# EasyEDA Pro project base_pcb.epro

# Board PCB1
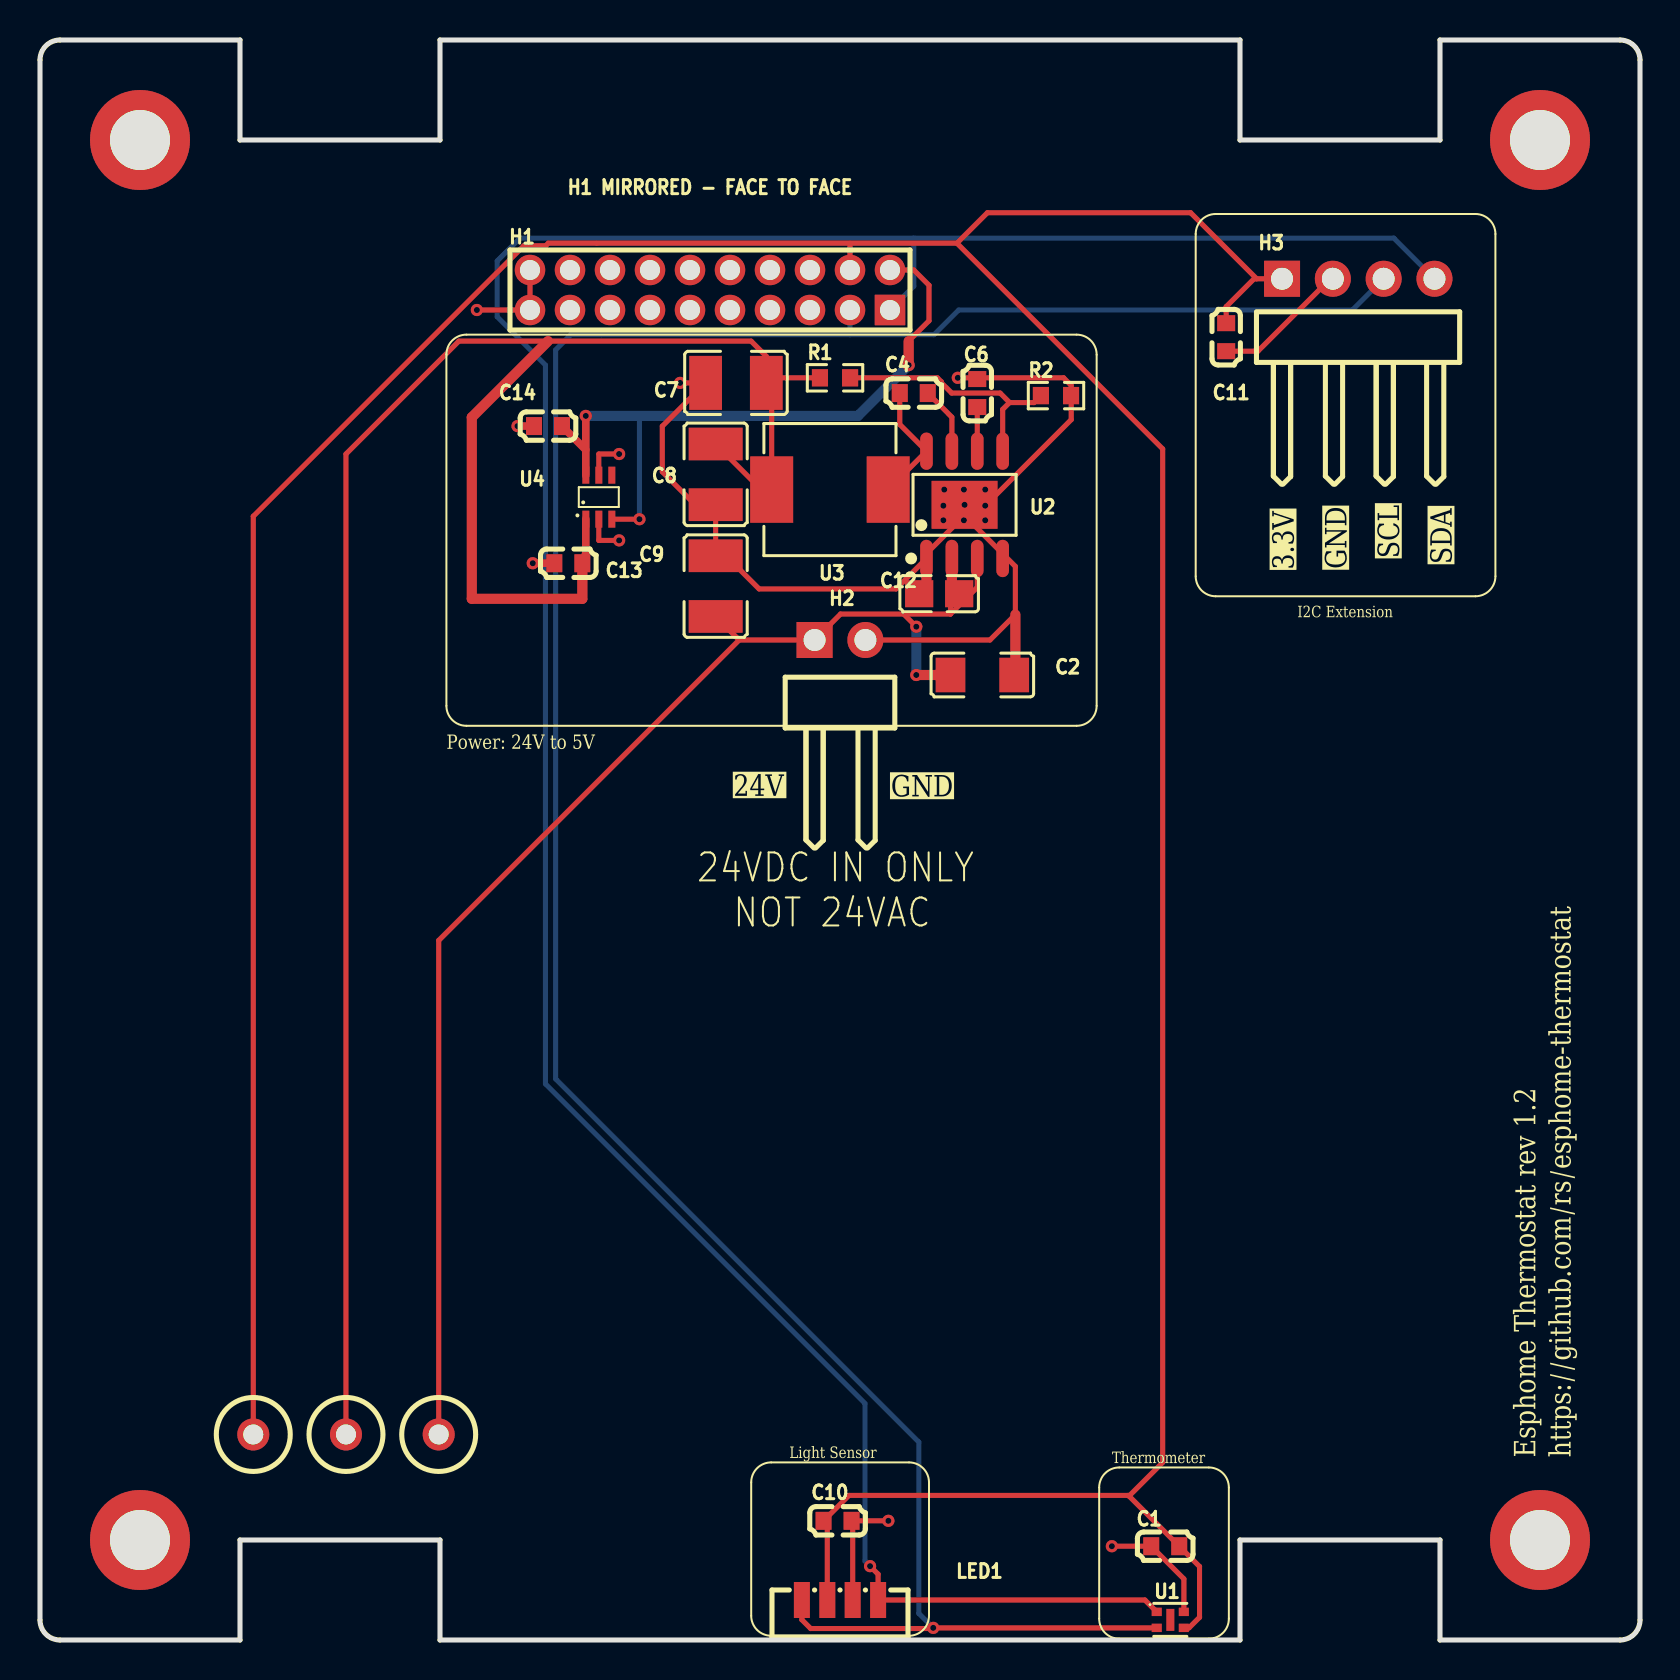
[diagram p0: board, top side]
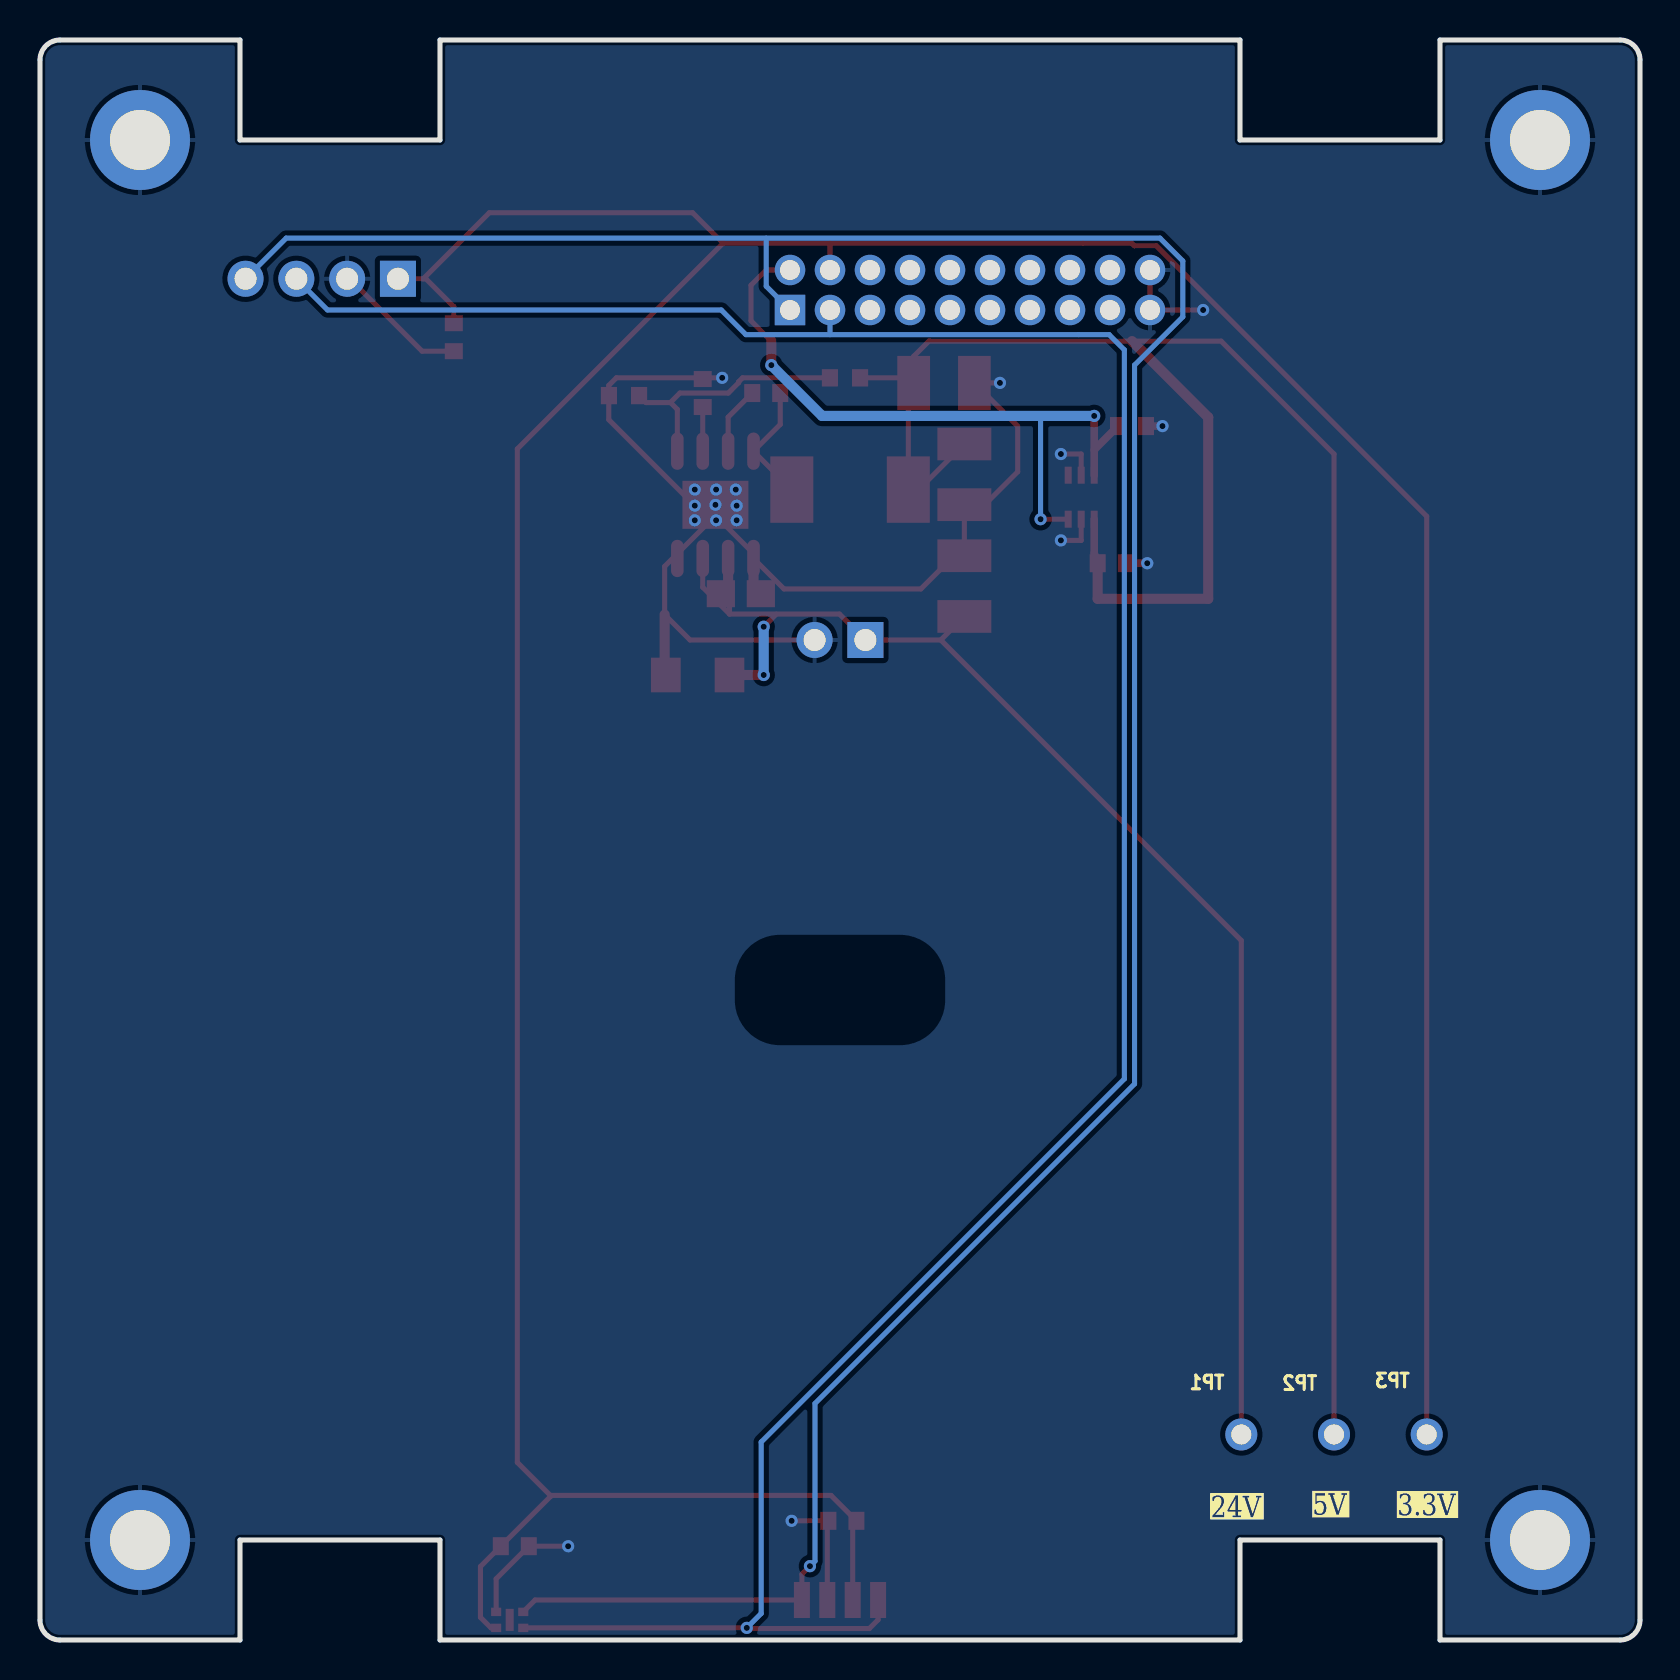
[diagram p1: board, bottom side, seen from below]

Outline 80 x 80 mm; copper layers: Top Layer, Bottom Layer. Coordinates in mm from the lower left corner of the outline.
Outline path: 0,79 0,1 arc(0.29,0.29) 1,0 10,0 10,5 20,5 20,0 60,0 60,5 70,5 70,0 79,0 arc(79.71,0.29) 80,1 80,79 arc(79.71,79.71) 79,80 70,80 70,75 60,75 60,80 20,80 20,75 10,75 10,80 1,80 arc(0.29,79.71) 0,79
Stack: Top Layer 0.035mm / Dielectric1 1.51mm FR4 er 4.5 / Bottom Layer 0.035mm

## Design rules (mm)
template: JLCPCB Capability(Two Layers Board)
spacing copperThickness1oz (default): track to track 0.102, other pairs 0.152 to 0.3
spacing copperThickness2oz: track to track 0.203, other pairs 0.152 to 0.3
track width copperThickness1oz (default): min 0.127, default 0.254, max 2.54
track width copperThickness2oz: min 0.203, default 0.254, max 2.54
differential pair differentialPair (default): width min 0.127, default 0.254, max 2.54; gap min 0.152, default 0.152
via viaSize (default): diameter min 0.5, default 0.61, max 10; hole min 0.3, default 0.305, max 6.3

## Placement (name value [footprint] x y rotation side)
C1  100nF  [C0603]  56.26 4.69 0 top
C2  4.7uF  [C1206]  47.12 48.25 0 top
C4  100nF  [C0603]  43.69 62.35 180 top
C6  1uF  [C0603]  46.86 62.35 270 top
C7  22uF  [C1210]  34.8 62.86 180 top
C8  22uF  [C1210]  33.78 58.28 270 top
C9  4.7uF  [C1210]  33.78 52.69 90 top
C10  100nF  [C0603]  39.88 5.96 180 top
C11  100nF  [C0603]  59.31 65.14 90 top
C12  220nF  [C0805]  44.96 52.31 180 top
C13  1uF  [C0603]  26.42 53.84 180 top
C14  1uF  [C0603]  25.4 60.7 180 top
H1  FG-PZ2.0-2-10P  [THERMOSTAT-H1-2X10-P2.00-MIRRORED-X]  33.5 67.5 0 top
H2  PZ254R-11-02P  [HDR-TH_2P-P2.54-H-M-W10.4]  40 50 0 top
H3  PZ254R-11-04P  [HDR-TH_4P-P2.54-H-M-W10.4]  65.91 68.06 0 top
LED1  VEML7700-TR  [LED-SMD_4P-L6.8-W2.4_VEML7700-TR]  40 2 180 top
NOREF  -  [Pad_e832]  5 75 0 top
NOREF#2  -  [Pad_e834]  5 5 0 top
NOREF#3  -  [Pad_e836]  75 75 0 top
NOREF#4  -  [Pad_e835]  75 5 0 top
R1  100kΩ  [R0603]  39.75 63.11 0 top
R2  24.9kΩ  [R0603]  50.8 62.22 0 top
TP1  -  [TESTPOINT-TH_TP_4]  19.94 10.28 0 top
TP2  -  [TESTPOINT-TH_TP_4]  15.3 10.28 0 top
TP3  -  [TESTPOINT-TH_TP_4]  10.66 10.28 0 top
U1  SHT45-AD1B-R2  [DFN-4_L1.5-W1.5-P0.8-TL-EP]  56.51 1.01 0 top
U2  LMR36510FADDAR  [ESOP-8_L4.9-W3.9-P1.27-LS6.0-BL-EP-1]  46.23 56.76 0 top
U3  22uH  [IND-SMD_L7.1-W6.6]  39.5 57.52 180 top
U4  LM66100DCKR  [SC-70-6_L2.0-W1.3-P0.65-LS2.1-BL]  27.94 57.14 0 top

## Footprints (pads in the part's own frame, mm; a bottom-side part is the same pattern mirrored in y, then rotated)
C0603
  rect 0.8x0.9 smd: 1(-0.7,0) 2(0.7,0)
C0805
  rect 1.41x1.35 smd: 1(-1,0) 2(1,0)
C1206
  rect 1.485x1.728 smd: 1(-1.593,0) 2(1.593,0)
C1210
  rect 1.635x2.7 smd: 1(-1.518,0) 2(1.518,0)
DFN-4_L1.5-W1.5-P0.8-TL-EP
  rect 0.505x0.42 smd: 1(-0.677,0.4) 2(-0.677,-0.4) 3(0.677,-0.4) 4(0.677,0.4)
  rect 0.4x1.1 smd: 5(0,0)
ESOP-8_L4.9-W3.9-P1.27-LS6.0-BL-EP-1
  oval 0.63x1.865 smd: 1(-1.905,-2.683) 2(-0.635,-2.683) 3(0.635,-2.683) 4(1.905,-2.683) 5(1.905,2.683) 6(0.635,2.683) 7(-0.635,2.683) 8(-1.905,2.683)
  rect 3.3x2.4 smd: 9(0,0)
HDR-TH_2P-P2.54-H-M-W10.4
  rect 1.8x1.8 hole 1.1: 1(-1.27,0)
  round 1.8 hole 1.1: 2(1.27,0)
HDR-TH_4P-P2.54-H-M-W10.4
  rect 1.8x1.8 hole 1.1: 1(-3.81,0)
  round 1.8 hole 1.1: 2(-1.27,0) 3(1.27,0) 4(3.81,0)
IND-SMD_L7.1-W6.6
  rect 2.15x3.32 smd: 1(-2.913,0) 2(2.913,0)
LED-SMD_4P-L6.8-W2.4_VEML7700-TR
  rect 0.8x1.8 smd: 1(1.905,0) 2(0.635,0) 3(-0.635,0) 4(-1.905,0)
Pad_e832
  round 5 hole 3: 1(0,0)
Pad_e834
  round 5 hole 3: 1(0,0)
Pad_e835
  round 5 hole 3: 1(0,0)
Pad_e836
  round 5 hole 3: 1(0,0)
R0603
  rect 0.806x0.864 smd: 1(-0.753,0) 2(0.753,0)
SC-70-6_L2.0-W1.3-P0.65-LS2.1-BL
  rect 0.35x0.85 smd: 1(-0.65,-1.1) 2(0,-1.1) 3(0.65,-1.1) 4(0.65,1.1) 5(0,1.1) 6(-0.65,1.1)
TESTPOINT-TH_TP_4
  round 1.6 hole 1: 1(0,0)
THERMOSTAT-H1-2X10-P2.00-MIRRORED-X
  rect 1.524x1.524 hole 1: 1(9,-1)
  round 1.524 hole 1: 2(9,1) 3(7,-1) 4(7,1) 5(5,-1) 6(5,1) 7(3,-1) 8(3,1) 9(1,-1) 10(1,1) 11(-1,-1) 12(-1,1) 13(-3,-1) 14(-3,1) 15(-5,-1) 16(-5,1) 17(-7,-1) 18(-7,1) 19(-9,-1) 20(-9,1)

## Nets
3V3: C1.2 C10.2 C11.2 H1.4 H3.1 LED1.2 TP3.1 U1.3
+5V: C7.1 C8.1 C13.1 R1.1 TP2.1 U3.2 U4.1
+5V_DISPLAY: C14.1 H1.2 U4.3 U4.6
+24V: C2.1 C9.1 C12.1 H2.1 TP1.1 U2.2 U2.3
GND: C1.1 C2.2 C6.1 C7.2 C8.2 C9.2 C10.1 C11.1 C12.2 C13.2 C14.2 H1.19 H1.20 H2.2 H3.2 LED1.3 NOREF.1 NOREF#2.1 NOREF#3.1 NOREF#4.1 R2.2 U1.4 U2.1 U2.4 U2.9 U4.2 U4.5
FB: R1.2 R2.1 U2.5
SCL: H1.3 H3.3 LED1.1 U1.2
SDA: H1.1 H3.4 LED1.4 U1.1
$1N2931: C4.2 U2.8 U3.1
$1N3165: C4.1 U2.7
$1N3213: C6.2 U2.6

Pads without a net: H1 5 6 7 8 9 10 11 12 13 14 15 16 17 18; U1 5; U4 4

## Via types
v1: diameter 0.61, hole 0.305, Top Layer to Bottom Layer, 25 vias

## Routing (per net, layer and track width the routed paths; a pad name or vN(x,y) marks a point on that pad's centre or on a via; arc(x,y) is an arc through that point)
3V3: length 205.9
  Top Layer w0.254: TP3.1 10.66,56.19 24.19,69.71 25.29,69.71 25.41,69.84 45.85,69.84 ; 54.45,7.2 C1.2 57.98,3.67 57.98,1.13 57.45,0.61 U1.3 ; 54.45,7.2 56.13,8.88 56.13,59.55 45.85,69.84 ; 54.45,7.2 54.42,7.23 40.45,7.23 C10.2 39.37,5.77 39.37,1.3 ; H3.1 60.83,68.06 ; 60.83,68.06 60.71,68.06 59.31,66.67 59.31,65.84 ; 60.83,68.06 57.53,71.36 47.37,71.36 45.85,69.84 ; H1.4 40.5,69.84
+5V: length 109.1
  Top Layer w0.254: TP2.1 15.3,59.3 20.94,64.94 35.55,64.94 36.32,64.18 C7.1 ; 36.58,62.47 U3.2 36.06,57.52 C8.1 ; 36.57,63.11 R1.1
  Top Layer w0.381: U4.1 27.29,54.35 C13.1
  Top Layer w0.508: C13.1 27.12,52.06 21.59,52.06 21.59,61.13 25.4,64.94
+5V_DISPLAY: length 35.1
  Top Layer w0.254: H1.2 43.69,68.5 44.45,67.74 44.45,65.96 43.43,64.94 ; U4.3 v1(29.97,56.04)
  Top Layer w0.381: U4.6 v1(27.29,61.2) ; 27.29,59.51 C14.1
  Top Layer w0.508: v1(43.43,63.74) 43.43,64.94
  Bottom Layer w0.254: v1(29.97,56.04) 29.97,61.2
  Bottom Layer w0.508: v1(43.43,63.74) 40.89,61.2 v1(27.29,61.2)
+24V: length 71.7
  Top Layer w0.254: 34.96,50 19.94,34.98 TP1.1 ; 34.96,50 C9.1 ; 34.96,50 H2.1 40.03,51.3 45.52,51.3 ; 45.52,51.3 46.86,52.64 U2.3 ; 45.52,51.3 45.52,54.01 ; 43.18,51.3 v1(43.81,50.66)
  Top Layer w0.508: 45.59,54.08 45.59,52.68 C12.1 ; v1(43.81,48.25) C2.1
  Bottom Layer w0.508: v1(43.81,50.66) v1(43.81,48.25)
GND: length 89.3
  Top Layer w0.254: H2.2 47.5,50 48.77,51.27 48.77,53.68 46.58,55.87 45.87,55.87 44.32,54.32 ; v1(21.84,66.5) H1.19 H1.20 ; v1(45.89,63.11) 51.18,63.11 51.56,62.73 51.56,61.02 v1(47.26,56.72) ; U4.5 27.94,59.3 v1(28.96,59.3) ; H3.2 64.52,68.06 60.9,64.44 C11.1 ; U4.2 27.94,54.98 v1(28.96,54.98) ; v1(32,62.86) C7.2 31.12,60.69 31.12,58.41 32.76,56.77 C8.2 C9.2 34.3,54.21 35.96,52.55 42.8,52.55 U2.1 ; 40.63,5.9 40.63,1.3 ; v1(53.59,4.69) C1.1 57.19,3.06 U1.4 ; C10.1 v1(42.42,5.96)
  Top Layer w0.381: C14.2 v1(23.88,60.7) ; C13.2 v1(24.64,53.84)
  Top Layer w0.508: U2.1 44.32,52.68 C12.2 ; 48.77,51.27 48.77,48.25
  vias: v1(45.21,57.52) v1(45.17,56.72) v1(45.17,55.99) v1(46.19,57.52) v1(46.23,56.76) v1(46.19,55.99) v1(47.26,57.52) v1(47.26,55.99)
FB: length 12.8
  Top Layer w0.254: 48.47,61.87 48.47,61.88 48.01,62.35 45.58,62.35 45.07,62.86 45.07,62.91 44.87,63.11 R1.2 ; 48.47,61.87 48.13,61.53 U2.5 ; 48.47,61.87 49.7,61.87 R2.1
SCL: length 134.8
  Top Layer w0.254: LED1.1 38.09,1.01 38.53,0.57 44.63,0.57 v1(44.66,0.61) U1.2
  Bottom Layer w0.254: H3.3 65.62,66.5 45.94,66.5 44.7,65.27 26.54,65.27 25.78,64.51 25.78,28.06 43.94,9.9 43.94,1.33 v1(44.66,0.61) ; H1.3 40.5,65.27
SDA: length 141.3
  Top Layer w0.254: U1.1 55.24,2 LED1.4 41.91,3.29 v1(41.5,3.69)
  Bottom Layer w0.254: H3.4 67.69,70.09 24,70.09 22.86,68.95 22.86,66.16 25.27,63.74 25.27,27.8 41.25,11.83 41.25,3.95 v1(41.5,3.69) ; H1.1 43.69,67.69 43.69,70.09
$1N2931: length 6.2
  Top Layer w0.254: U3.1 44.32,59.43 U2.8 42.99,60.78 C4.2
$1N3165: length 3.4
  Top Layer w0.254: 45.59,59.44 45.59,61.14 C4.1
$1N3213: length 2.2
  Top Layer w0.254: 46.86,61.65 U2.6

## Copper pours and planes (outline as drawn; the poured copper is in the pictures)
GND on Bottom Layer: 0,80 80,80 80,0 0,0

## Text on the board
Bottom Silkscreen Layer: 3.3V | 5V | 24V
Top Silkscreen Layer: H1 MIRRORED - FACE TO FACE | 24VDC IN ONLY / NOT 24VAC | Light Sensor | Thermometer | I2C Extension | Power: 24V to 5V | 24V | GND | 3.3V | SCL | SDA | Esphome Thermostat rev 1.2 / https://github.com/rs/esphome-thermostat
